# Altium schematic sheet 03.Quadro_Superior.SchDoc
size A4
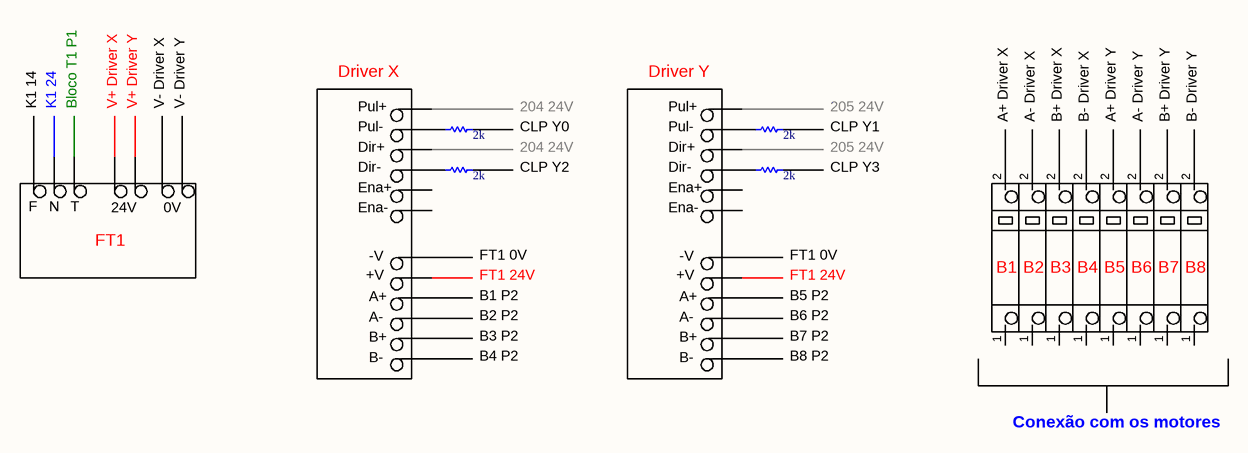
[diagram p0: 03.Quadro_Superior.SchDoc]

## Parts
Bloco12  Bloco_Passagem  (value not drawn)
Bloco13  Bloco_Passagem  (value not drawn)
Bloco14  Bloco_Passagem  (value not drawn)
Bloco15  Bloco_Passagem  (value not drawn)
Bloco16  Bloco_Passagem  (value not drawn)
Bloco17  Bloco_Passagem  (value not drawn)
Bloco18  Bloco_Passagem  (value not drawn)
Bloco19  Bloco_Passagem  (value not drawn)
DRV1  Driver DM542E  (value not drawn)
DRV2  Driver DM542E  (value not drawn)
FT1  Fonte 24V_2  (value not drawn)
R1  2k  [2k2 1/4W RES-40]
R2  2k  [2k2 1/4W RES-40]
R3  2k  [2k2 1/4W RES-40]
R4  2k  [2k2 1/4W RES-40]

## Nets
NetDRV1_6: DRV1.6 R2.1
NetDRV1_7: DRV1.7 R1.1
NetDRV2_6: DRV2.6 R4.1
NetDRV2_7: DRV2.7 R3.1

Not connected (* = marked no-connect by the designer): Bloco12 1 2; Bloco13 1 2; Bloco14 1 2; Bloco15 1 2; Bloco16 1 2; Bloco17 1 2; Bloco18 1 2; Bloco19 1 2; DRV1 8; DRV2 8; FT1 6 7 8 9 10; R1 2; R2 2; R3 2; R4 2

## Notes on the sheet
- (near DRV1) Driver X
- (near DRV2) Driver Y
- K1 14
- K1 24
- Bloco T1 P1
- V+ Driver X
- V+ Driver Y
- V- Driver X
- V- Driver Y
- CLP Y0
- 204 24V
- CLP Y1
- 205 24V
- A+ Driver X
- A- Driver X
- B+ Driver X
- B- Driver X
- A+ Driver Y
- A- Driver Y
- B+ Driver Y
- B- Driver Y
- CLP Y2
- CLP Y3
- (near FT1) FT1
- FT1 0V
- FT1 24V
- B1 P2
- B5 P2
- (near Bloco12) B1
- (near Bloco13) B2
- (near Bloco14) B3
- (near Bloco15) B4
- (near Bloco16) B5
- (near Bloco17) B6
- (near Bloco18) B7
- (near Bloco19) B8
- B2 P2
- B3 P2
- B4 P2
- B6 P2
- B7 P2
- B8 P2
- Conexão com os motores
- Esquemático
- Projeto
- Folha
- Projetista
- A4
- Revisão
- Página
- Data
- LABSOLDA
- (in symbol Driver DM542E) Pul+; Pul-; Dir+; Dir-; Ena+; Ena-; -V; +V; A+; A-; B+; B-
- (in symbol Fonte 24V_2) F; N; T; 24V; 0V

## Library data of the parts
R1-R4 = 2k2 1/4W: RESISTOR AXIAL 2k2 1/4W +-5%